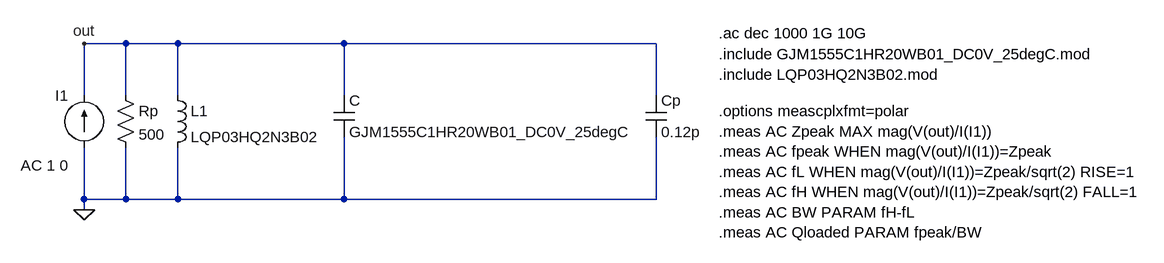
[diagram p0: schematic simulation.asc]
simulation.asc, the LTspice schematic file:
Version 4.1
SHEET 1 1828 680
WIRE 192 32 128 32
WIRE 272 32 192 32
WIRE 528 32 272 32
WIRE 1008 32 528 32
WIRE 128 112 128 32
WIRE 192 112 192 32
WIRE 272 112 272 32
WIRE 528 112 528 32
WIRE 1008 112 1008 32
WIRE 128 272 128 192
WIRE 192 272 192 192
WIRE 192 272 128 272
WIRE 272 272 272 192
WIRE 272 272 192 272
WIRE 528 272 528 176
WIRE 528 272 272 272
WIRE 1008 272 1008 176
WIRE 1008 272 528 272
WIRE 128 288 128 272
FLAG 128 288 0
FLAG 128 32 out
SYMBOL current 128 192 R180
WINDOW 0 24 80 Left 2
WINDOW 3 24 0 Left 2
WINDOW 123 24 -28 Left 2
WINDOW 39 0 0 Left 0
SYMATTR InstName I1
SYMATTR Value ""
SYMATTR Value2 AC 1 0
SYMBOL res 176 96 R0
SYMATTR InstName Rp
SYMATTR Value 500
SYMBOL cap 512 112 R0
SYMATTR InstName C
SYMATTR Value GJM1555C1HR20WB01_DC0V_25degC
SYMATTR Prefix x
SYMBOL cap 992 112 R0
SYMATTR InstName Cp
SYMATTR Value 0.12p
SYMBOL ind 256 96 R0
SYMATTR InstName L1
SYMATTR Value LQP03HQ2N3B02
SYMATTR Prefix X
TEXT 1104 16 Left 2 !.ac dec 1000 1G 10G
TEXT 1104 136 Left 2 !.options meascplxfmt=polar\n.meas AC Zpeak MAX mag(V(out)/I(I1)) \n.meas AC fpeak WHEN mag(V(out)/I(I1))=Zpeak\n.meas AC fL WHEN mag(V(out)/I(I1))=Zpeak/sqrt(2) RISE=1\n.meas AC fH WHEN mag(V(out)/I(I1))=Zpeak/sqrt(2) FALL=1\n.meas AC BW PARAM fH-fL\n.meas AC Qloaded PARAM fpeak/BW
TEXT 1104 48 Left 2 !.include GJM1555C1HR20WB01_DC0V_25degC.mod
TEXT 1104 80 Left 2 !.include LQP03HQ2N3B02.mod

The netlist it stands for:
* simulation.asc
I1 0 out AC 1 0
Rp out 0 500
X§C out 0 GJM1555C1HR20WB01_DC0V_25degC  ; pins A B
Cp out 0 0.12p
X§L1 out 0 LQP03HQ2N3B02  ; pins A B
.ac dec 1000 1G 10G
.options meascplxfmt=polar
.meas AC Zpeak MAX mag(V(out)/I(I1))
.meas AC fpeak WHEN mag(V(out)/I(I1))=Zpeak
.meas AC fL WHEN mag(V(out)/I(I1))=Zpeak/sqrt(2) RISE=1
.meas AC fH WHEN mag(V(out)/I(I1))=Zpeak/sqrt(2) FALL=1
.meas AC BW PARAM fH-fL
.meas AC Qloaded PARAM fpeak/BW
.include GJM1555C1HR20WB01_DC0V_25degC.mod
.include LQP03HQ2N3B02.mod
.backanno
.end